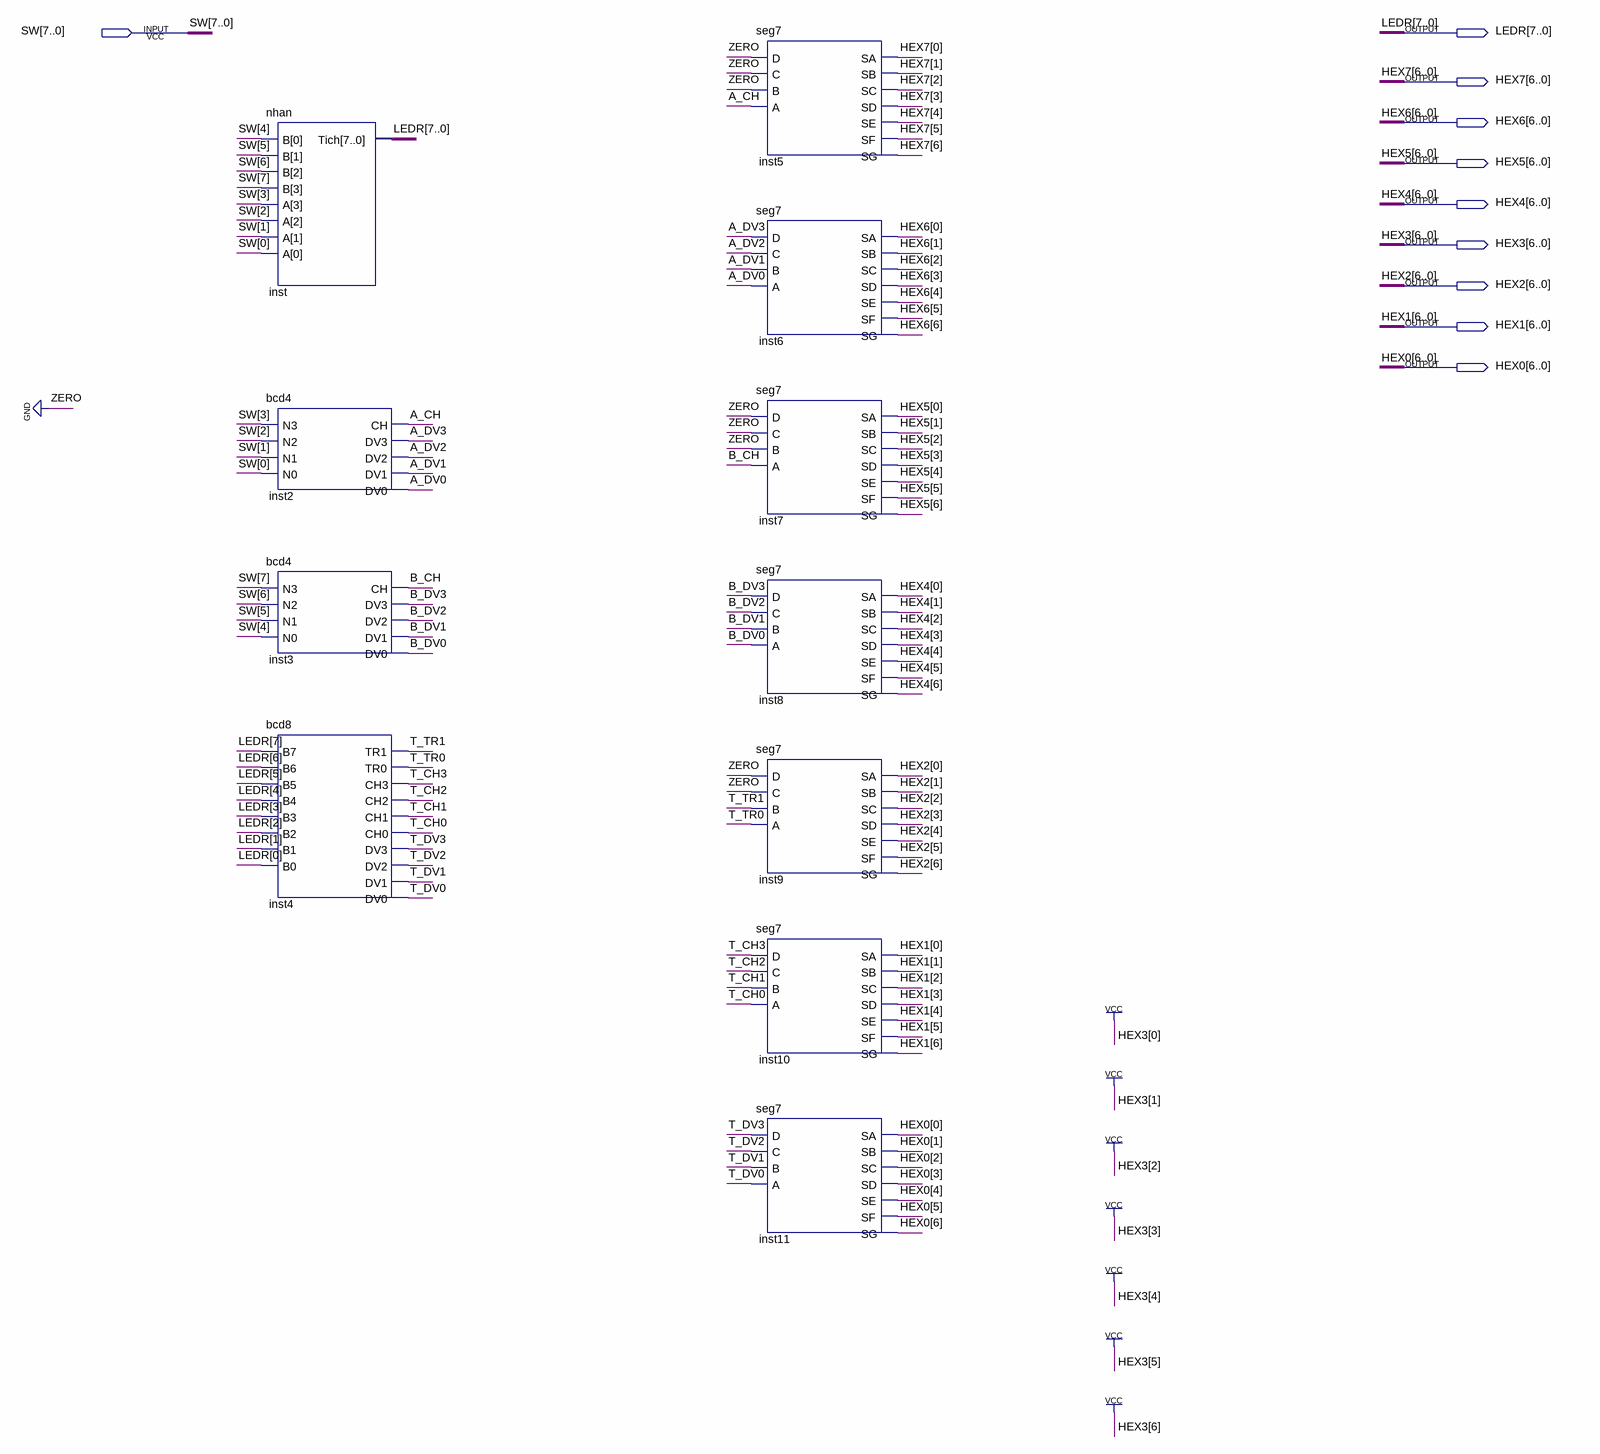
[diagram p0: schematic sheet]
// Quartus schematic hien_thi.bdf as structural Verilog: 11 symbols, 10 pins
module hien_thi (
  input  [7:0] SW,
  output [7:0] LEDR,
  output [6:0] HEX7,
  output [6:0] HEX6,
  output [6:0] HEX5,
  output [6:0] HEX4,
  output [6:0] HEX3,
  output [6:0] HEX2,
  output [6:0] HEX1,
  output [6:0] HEX0
);

  wire A_CH, A_DV0, A_DV1, A_DV2, A_DV3, B_CH, B_DV0, B_DV1, B_DV2, B_DV3, T_CH0, T_CH1, T_CH2, T_CH3, T_DV0,
       T_DV1, T_DV2, T_DV3, T_TR0, T_TR1;

  nhan inst (.B(SW[7:4]), .A(SW[3:0]), .Tich(LEDR));
  bcd4 inst2 (
    .N3(SW[3]), .N2(SW[2]), .N1(SW[1]), .N0(SW[0]), .CH(A_CH), .DV3(A_DV3), .DV2(A_DV2), .DV1(A_DV1),
    .DV0(A_DV0));
  bcd4 inst3 (
    .N3(SW[7]), .N2(SW[6]), .N1(SW[5]), .N0(SW[4]), .CH(B_CH), .DV3(B_DV3), .DV2(B_DV2), .DV1(B_DV1),
    .DV0(B_DV0));
  bcd8 inst4 (
    .B7(LEDR[7]), .B6(LEDR[6]), .B5(LEDR[5]), .B4(LEDR[4]), .B3(LEDR[3]), .B2(LEDR[2]), .B1(LEDR[1]),
    .B0(LEDR[0]), .TR1(T_TR1), .TR0(T_TR0), .CH3(T_CH3), .CH2(T_CH2), .CH1(T_CH1), .CH0(T_CH0), .DV3(T_DV3),
    .DV2(T_DV2), .DV1(T_DV1), .DV0(T_DV0));
  seg7 inst5 (
    .D(1'b0), .C(1'b0), .B(1'b0), .A(A_CH), .SA(HEX7[0]), .SB(HEX7[1]), .SC(HEX7[2]), .SD(HEX7[3]),
    .SE(HEX7[4]), .SF(HEX7[5]), .SG(HEX7[6]));
  seg7 inst6 (
    .D(A_DV3), .C(A_DV2), .B(A_DV1), .A(A_DV0), .SA(HEX6[0]), .SB(HEX6[1]), .SC(HEX6[2]), .SD(HEX6[3]),
    .SE(HEX6[4]), .SF(HEX6[5]), .SG(HEX6[6]));
  seg7 inst7 (
    .D(1'b0), .C(1'b0), .B(1'b0), .A(B_CH), .SA(HEX5[0]), .SB(HEX5[1]), .SC(HEX5[2]), .SD(HEX5[3]),
    .SE(HEX5[4]), .SF(HEX5[5]), .SG(HEX5[6]));
  seg7 inst8 (
    .D(B_DV3), .C(B_DV2), .B(B_DV1), .A(B_DV0), .SA(HEX4[0]), .SB(HEX4[1]), .SC(HEX4[2]), .SD(HEX4[3]),
    .SE(HEX4[4]), .SF(HEX4[5]), .SG(HEX4[6]));
  seg7 inst9 (
    .D(1'b0), .C(1'b0), .B(T_TR1), .A(T_TR0), .SA(HEX2[0]), .SB(HEX2[1]), .SC(HEX2[2]), .SD(HEX2[3]),
    .SE(HEX2[4]), .SF(HEX2[5]), .SG(HEX2[6]));
  seg7 inst10 (
    .D(T_CH3), .C(T_CH2), .B(T_CH1), .A(T_CH0), .SA(HEX1[0]), .SB(HEX1[1]), .SC(HEX1[2]), .SD(HEX1[3]),
    .SE(HEX1[4]), .SF(HEX1[5]), .SG(HEX1[6]));
  seg7 inst11 (
    .D(T_DV3), .C(T_DV2), .B(T_DV1), .A(T_DV0), .SA(HEX0[0]), .SB(HEX0[1]), .SC(HEX0[2]), .SD(HEX0[3]),
    .SE(HEX0[4]), .SF(HEX0[5]), .SG(HEX0[6]));

  assign HEX3 = {7{1'b1}};
endmodule
